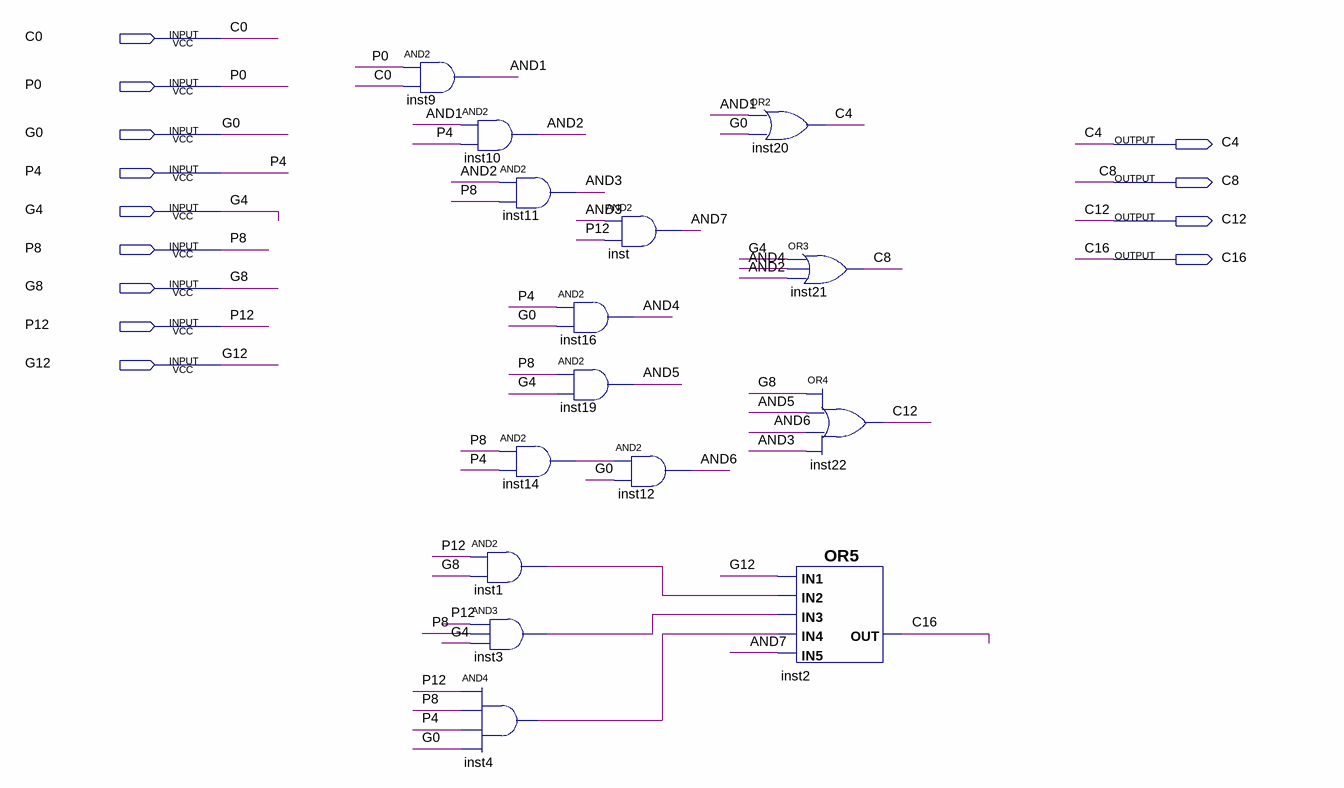
[diagram p0: schematic sheet]
// Quartus schematic LCU_16bit.bdf as structural Verilog: 15 symbols, 13 pins
module LCU_16bit (
  input  C0,
  input  P0,
  input  G0,
  input  P4,
  input  G4,
  input  P8,
  input  G8,
  input  P12,
  input  G12,
  output C4,
  output C8,
  output C12,
  output C16
);

  wire AND1, AND2, AND3, AND4, AND5, AND6, AND7, inst1_out, inst3_out, inst4_out, inst14_out;

  and inst9 (AND1, P0, C0);
  and inst10 (AND2, AND1, P4);
  and inst11 (AND3, AND2, P8);
  and inst14 (inst14_out, P8, P4);
  and inst1 (inst1_out, P12, G8);
  and inst3 (inst3_out, P12, P8, G4);
  and inst4 (inst4_out, P12, P8, P4, G0);
  and inst16 (AND4, P4, G0);
  and inst19 (AND5, P8, G4);
  and inst (AND7, AND3, P12);
  and inst12 (AND6, inst14_out, G0);
  or inst20 (C4, AND1, G0);
  or inst21 (C8, G4, AND4, AND2);
  or inst22 (C12, G8, AND5, AND6, AND3);
  or inst2 (C16, G12, inst1_out, inst3_out, inst4_out, AND7);
endmodule
